# Altium project avr32da32_evalboard.PrjPcb
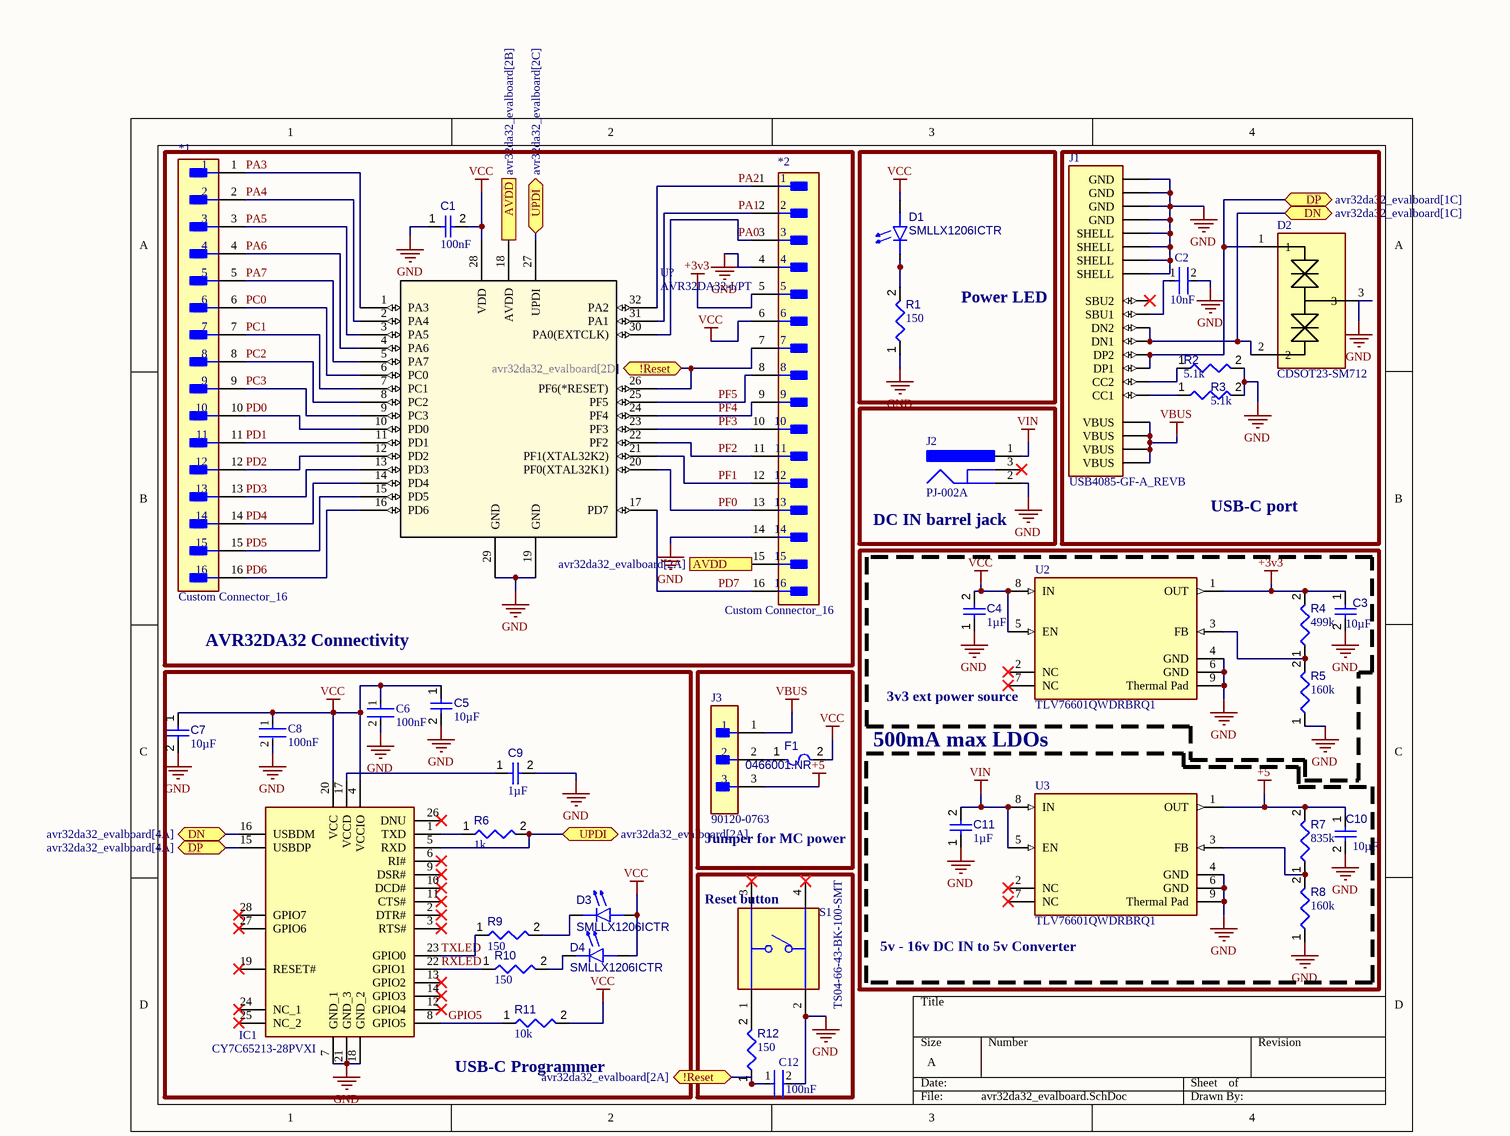
[diagram p0: avr32da32_evalboard.SchDoc]
1 sheet, 39 parts. Net scope: flat (ports and power ports of the same name join across sheets).
Board file: avr32da32_evalboard.PcbDoc

## Sheet avr32da32_evalboard.SchDoc
size A; SheetNumber: 1; SheetTotal: 1

### Parts
*1  Custom Connector_16  [Custom Connector_16]
*2  Custom Connector_16  [Custom Connector_16]
C1  value 100nF  [CAPC3216X180X50ML20T25]  (hidden comment: Capacitor 10 uF +/- 10% 16 V 1206)
C2  10nF  [FP-GR331B-0_2-IPC_C]
C3  value 10µF  [CAPC3216X180X50NL20T25]  (hidden comment: Capacitor 10 uF +/- 10% 16 V 1206)
C4  value 1µF  [CAPC3216X180X20ML20]  (hidden comment: Capacitor 1 uF +/- 10% 25 V 1206)
C5  value 10µF  [CAPC3216X180X50NL20T25]  (hidden comment: Capacitor 10 uF +/- 10% 16 V 1206)
C6  100nF  [FP-1206-L_3_2_0_2-W_1_6_0-MFG]
C7  value 10µF  [CAPC3216X180X50NL20T25]  (hidden comment: Capacitor 10 uF +/- 10% 16 V 1206)
C8  100nF  [FP-1206-L_3_2_0_2-W_1_6_0-MFG]
C9  value 1µF  [CAPC3216X180X20ML20]  (hidden comment: Capacitor 1 uF +/- 10% 25 V 1206)
C10  value 10µF  [CAPC3216X180X50NL20T25]  (hidden comment: Capacitor 10 uF +/- 10% 16 V 1206)
C11  value 1µF  [CAPC3216X180X20ML20]  (hidden comment: Capacitor 1 uF +/- 10% 25 V 1206)
C12  100nF  [FP-1206-L_3_2_0_2-W_1_6_0-MFG]
D1  SMLLX1206ICTR  [LUMX-SML-LX1206IC_V]
D2  CDSOT23-SM712  [SOT95P230X117-3N]
D3  SMLLX1206ICTR  [LUMX-SML-LX1206IC_V]
D4  SMLLX1206ICTR  [LUMX-SML-LX1206IC_V]
F1  0466001.NR  [FP-0466-MFG]
IC1  CY7C65213-28PVXI  [SOP65P780X200-28N]
J1  USB4085-GF-A_REVB  [GCT_USB4085-GF-A_REVB]
J2  PJ-002A  [CUI-PJ-002A_V]
J3  90120-0763  [FP-90120-0763-MFG]
R1  value 150  [FP-CR1206-IPC_C]  (hidden comment: CR1206-JW-151ELF)
R2  value 5.1k  [FP-CR1206-IPC_C]  (hidden comment: CR1206-JW-151ELF)
R3  value 5.1k  [FP-CR1206-IPC_C]  (hidden comment: CR1206-JW-151ELF)
R4  value 499k  [FP-RT1206-IPC_C]  (hidden comment: RT1206DRD07499KL)
R5  value 160k  [FP-RT1206-IPC_C]  (hidden comment: RT1206FRE07160KL)
R6  value 1k  [FP-MCA1206-IPC_B]  (hidden comment: MCA1206MD1001BP100)
R7  value 835k  [FP-RT1206-IPC_C]  (hidden comment: RT1206DRD07499KL)
R8  value 160k  [FP-RT1206-IPC_C]  (hidden comment: RT1206FRE07160KL)
R9  value 150  [FP-CR1206-IPC_C]  (hidden comment: CR1206-JW-151ELF)
R10  value 150  [FP-CR1206-IPC_C]  (hidden comment: CR1206-JW-151ELF)
R11  value 10k  [RESC3216X60X45ML15T20]  (hidden comment: Resistor 10k +/-1% 1206 250 mW)
R12  value 150  [FP-CR1206-IPC_C]  (hidden comment: CR1206-JW-151ELF)
S1  TS04-66-43-BK-100-SMT  [SW_TS04-66-43-BK-100-SMT]
U2  TLV76601QWDRBRQ1  [FP-DRB0008J-IPC_C]
U3  TLV76601QWDRBRQ1  [FP-DRB0008J-IPC_C]
U?  AVR32DA32-I/PT  [QFP80P900X900X120-32N]

### Blocks framed on the sheet
AVR32DA32 Connectivity: *1 *2 C1 U?
Power LED: D1 R1
USB-C port: C2 D2 J1 R2 R3
DC IN barrel jack: J2
3v3 ext power source: C3 C4 R4 R5 U2
USB-C Programmer: C5-C9 D3 D4 IC1 R6 R9-R11
Jumper for MC power: F1 J3
500mA max LDOs: C10 C11 R7 R8 U3
Reset button: C12 R12 S1

### Ports
!Reset (bidir, see avr32da32_evalboard[2A]), !Reset (bidir, see avr32da32_evalboard[2D]), AVDD (see avr32da32_evalboard[2A]), AVDD (see avr32da32_evalboard[2B]), DN (bidir, see avr32da32_evalboard[1C]), DN (bidir, see avr32da32_evalboard[4A]), DP (bidir, see avr32da32_evalboard[1C]), DP (bidir, see avr32da32_evalboard[4A]), UPDI (bidir, see avr32da32_evalboard[2A]), UPDI (bidir, see avr32da32_evalboard[2C])

### Nets
+3v3: *2.5 C3.1 R4.2 U2.1(OUT)
+5: C10.1 J3.3 R7.2 U3.1(OUT)
GND: *2.4 *2.14 C1.1 C2.2 C3.2 C4.1 C5.2 C6.2 C7.2 C8.2 C9.2 C10.2 C11.1 C12.2 D2.3 IC1.7(GND_1) IC1.18(GND_2) IC1.21(GND_3) J1.A1(GND) J1.A12(GND) J1.B1(GND) J1.B12(GND) J1.S1(SHELL) J1.S2(SHELL) J1.S3(SHELL) J1.S4(SHELL) J2.2 R1.1 R2.2 R3.2 R5.1 R8.1 S1.2 U2.4(GND) U2.6(GND) U2.9(Thermal_Pad) U3.4(GND) U3.6(GND) U3.9(Thermal_Pad) U?.19(GND) U?.29(GND)
VBUS: J1.A4(VBUS) J1.A9(VBUS) J1.B4(VBUS) J1.B9(VBUS) J3.1
VCC: *2.6 C1.2 C4.2 C5.1 C6.1 C7.1 C8.1 D1.2(A) D3.2(A) D4.2(A) F1.2 IC1.4(VCCIO) IC1.20(VCC) R11.2 U2.5(EN) U2.8(IN) U?.28(VDD)
VIN: C11.2 J2.1 U3.5(EN) U3.8(IN)
GPIO5: IC1.8(GPIO5) R11.1
PA0: *2.3 U?.30(PA0(EXTCLK))
PA1: *2.2 U?.31(PA1)
PA2: *2.1 U?.32(PA2)
PA3: *1.1 U?.1(PA3)
PA4: *1.2 U?.2(PA4)
PA5: *1.3 U?.3(PA5)
PA6: *1.4 U?.4(PA6)
PA7: *1.5 U?.5(PA7)
PC0: *1.6 U?.6(PC0)
PC1: *1.7 U?.7(PC1)
PC2: *1.8 U?.8(PC2)
PC3: *1.9 U?.9(PC3)
PD0: *1.10 U?.10(PD0)
PD1: *1.11 U?.11(PD1)
PD2: *1.12 U?.12(PD2)
PD3: *1.13 U?.13(PD3)
PD4: *1.14 U?.14(PD4)
PD5: *1.15 U?.15(PD5)
PD6: *1.16 U?.16(PD6)
PD7: *2.16 U?.17(PD7)
PF0: *2.13 U?.20(PF0(XTAL32K1))
PF1: *2.12 U?.21(PF1(XTAL32K2))
PF2: *2.11 U?.22(PF2)
PF3: *2.10 U?.23(PF3)
PF4: *2.9 U?.24(PF4)
PF5: *2.8 U?.25(PF5)
RXLED: IC1.22(GPIO1) R10.1
TXLED: IC1.23(GPIO0) R9.1
Net*2_7: *2.7 C12.1 R12.1 U?.26(PF6(*RESET)) ; port !Reset
Net*2_15: *2.15 U?.18(AVDD) ; port AVDD
NetC2_1: C2.1 J1.A8(SBU1)
NetC9_1: C9.1 IC1.17(VCCD)
NetD1_1: D1.1(K) R1.2
NetD2_1: D2.1 IC1.15(USBDP) J1.A6(DP1) J1.B6(DP2) ; port DP
NetD2_2: D2.2 IC1.16(USBDM) J1.A7(DN1) J1.B7(DN2) ; port DN
NetD3_1: D3.1(K) R9.2
NetD4_1: D4.1(K) R10.2
NetF1_1: F1.1 J3.2
NetIC1_1: IC1.1(TXD) R6.1
NetIC1_5: IC1.5(RXD) R6.2 U?.27(UPDI) ; port UPDI
NetJ1_A5: J1.A5(CC1) R3.1
NetJ1_B5: J1.B5(CC2) R2.1
NetR4_1: R4.1 R5.2 U2.3(FB)
NetR7_1: R7.1 R8.2 U3.3(FB)
NetR12_2: R12.2 S1.1

Not connected (* = marked no-connect by the designer): IC1 2(DTR#)* 3(RTS#)* 6(RI#)* 9(DSR#)* 10(DCD#)* 11(CTS#)* 12(GPIO4)* 13(GPIO2)* 14(GPIO3)* 19(RESET#)* 24(NC_1)* 25(NC_2)* 26(DNU)* 27(GPIO6)* 28(GPIO7)*; J1 B8(SBU2)*; J2 3*; S1 3* 4*; U2 2(NC)* 7(NC)*; U3 2(NC)* 7(NC)*

### Notes on the sheet
- (near U3) 5v - 16v DC IN to 5v Converter

### Library data of the parts
C1 C3 C5 C7 C10 = CMP-001-00016-6: Chip Capacitor, 10 uF, +/- 10%, 16 V, 1206 (3216 Metric); Capacitor Type: Ceramic; Voltage Rating: 16V; Tolerance: 10%; Min Operating Temperature: -55°C; Pins: 2; Mounting Technology: SM; Case/Package: 1206; Max Operating Temperature: 125°C; RoHS Compliant: True
C2 = CMP-06035-062347-1: CAP CER 10000PF 630V X7T 1206; Tolerance: 10%; Mount: Surface Mount; RoHS Compliant: Yes; Case/Package: 1206; Capacitance: 10nF; Construction: Flat; Series: GR3; REACH SVHC: No SVHC; Case Code (Imperial): 1206; Min Operating Temperature: -55°C; Depth: 1.6mm; Voltage Rating (DC): 630V; Height: 1.25mm; Max Operating Temperature: 125°C; Termination: SMD/SMT; Dielectric: X7T; Voltage Rating: 630V; Thickness: 0.049inch; Package Quantity: 1; Case Code (Metric): 3216; Radiation Hardening: No; Length: 3.2mm; Width: 0.063inch; Packaging: Tape and Reel
C4 C9 C11 = CMP-001-00006-6: Chip Capacitor, 1 uF, +/- 10%, 25 V, 1206 (3216 Metric); Capacitor Type: Ceramic; Voltage Rating: 25V; Tolerance: 10%; Min Operating Temperature: -55°C; Pins: 2; Case/Package: 1206; Max Operating Temperature: 125°C; Mounting Technology: SM; RoHS Compliant: True
C6 C8 C12 = CMP-2000-05018-2: General Purpose Ceramic Capacitor, 1206, 100nF, 10%, X7R, 15%, 50V; Dissipation Factor: 2.5%; Insulation Resistance: 100GR; Dielectric: X7R; Thickness: 0.037inch; Case Code (Imperial): 1206; Case Code (Metric): 3216; Dielectric Material: Ceramic; Width: 1.6mm; Voltage Rating (DC): 50V; Termination: SMD/SMT; Tolerance: 10%; REACH SVHC: No SVHC; Height: 0.94mm; Length: 3.2mm; Voltage: 50V; Capacitance: 100nF; Packaging: Tape and Reel; Depth: 1.6mm; Voltage Rating: 50V; Series: -; Contact Plating: Tin; Mount: Surface Mount; Package Quantity: 1; Construction: Flat; Max Operating Temperature: 125°C; Min Operating Temperature: -55°C; Case/Package: 1206; Lead Free: Lead Free; RoHS Compliant: Yes; Number of Pins: 2; Radiation Hardening: No
D1 D3 D4 = CMP-007-00044-1: LED Uni-Color Red 635nm 2-Pin T/R
D2 = CDSOT23-SM712: Diode; Manufacturer_Name: Bourns; Datasheet Link: http://uk.rs-online.com/web/p/products/7673728; Height: 1.17mm; Manufacturer_Part_Number: CDSOT23-SM712; Mouser Part Number: 652-CDSOT23-SM712; Mouser Price/Stock: https://www.mouser.co.uk/ProductDetail/Bourns/CDSOT23-SM712?qs=FuI%252BOVLl4%2FLTY%2FGQ265RLA%3D%3D; Arrow Part Number: CDSOT23-SM712; Arrow Price/Stock: https://www.arrow.com/en/products/cdsot23-sm712/bourns?utm_currency=USD&region=europe
F1 = CMP-005-00014-1: Electric Fuse, Very Fast Blow, 1A, 63VAC, 63VDC, 50A (IR), Surface Mount, 1206; Current Rating: 1A; RoHS Compliant: Yes; Min Operating Temperature: -55°C; Mounting Technology: Surface Mount; Max Operating Temperature: 90°C
IC1 = CY7C65213-28PVXI: Integrated Circuit; Manufacturer_Name: Infineon; Datasheet Link: http://www.mouser.com/datasheet/2/100/001-81011_CY7C65213_USB-UART_LP_Bridge_Controller_-348826.pdf; Height: 2mm; Manufacturer_Part_Number: CY7C65213-28PVXI; Mouser Part Number: 727-CY7C65213-28PVXI; Mouser Price/Stock: https://www.mouser.co.uk/ProductDetail/Infineon-Technologies/CY7C65213-28PVXI?qs=dOK1vf2izjvExqwVZ7qYig%3D%3D; Arrow Part Number: CY7C65213-28PVXI; Arrow Price/Stock: https://www.arrow.com/en/products/cy7c65213-28pvxi/cypress-semiconductor?region=nac
J1 = CMP-012-000000-1: USB-C (USB TYPE-C) USB 2.0 æ’åº§è¿žæŽ¥å™¨ 24 (16+8 Dummy) ä½é€šå­”ã€ç›´è§’ã€ä½Žæˆæœ¬ã€3.46mm å¤–å½¢ã€16 é’ˆã€æ°´å¹³ã€é¡¶éƒ¨å®‰è£…; MF: Global Connector Technology; Pin Count: 20; Package: None; Check_prices: https://www.snapeda.com/parts/USB4085-GF-A/Global+Connector+Technology/view-part/?ref=eda; Value: *; Design Item ID: USB4085-GF-A_REVB; MP: USB4085-GF-A; Component Type: Standard; SnapEDA_Link: https://www.snapeda.com/parts/USB4085-GF-A/Global+Connector+Technology/view-part/?ref=snap; Source: USB4085-GF-A_REVB.SchLib
J2 = CMP-002-00078-1: 12V, 1A, 2mm Dia; Connector Type: Circular,Power; Voltage Rating: 12V; Mounting Technology: Board; RoHS Compliant: Yes
J3 = CMP-002-00075-2: Board Connector, 3 Contact(s), 1 Row(s), Male, Straight, 0.1 inch Pitch, Solder Terminal, Black Insulator, Receptacle; Mounting Technology: Board; Max Operating Temperature: 125°C; Connector Type: BOARD CONNECTOR; Min Operating Temperature: -55°C; RoHS Compliant: Yes
R1-R3 R9 R10 R12 = CMP-009-00182-1: Fixed Resistor, Metal Glaze/thick Film, 0.25W, 150ohm, 200V, 5% +/-Tol, 200ppm/Cel, Surface Mount, 1206; Power: 250mW; Case/Package: 1206; RoHS Compliant: Yes; Max Operating Temperature: 155°C; Tolerance: 5%; Pins: 2; Mounting Technology: Surface Mount; Min Operating Temperature: -55°C
R4 R7 = CMP-009-00185-1: Fixed Resistor, Thin Film, 0.25W, 499000ohm, 200V, 0.5% +/-Tol, 25ppm/Cel, Surface Mount, 1206; Power: 250mW; RoHS Compliant: Yes; Min Operating Temperature: -55°C; Pins: 2; Mounting Technology: Surface Mount; Case/Package: 1206; Max Operating Temperature: 155°C; Tolerance: 0.5%
R5 R8 = CMP-009-00184-1: Fixed Resistor, Thin Film, 0.25W, 160000ohm, 200V, 1% +/-Tol, 50ppm/Cel, Surface Mount, 1206; Power: 250mW; RoHS Compliant: Yes; Tolerance: 1%; Case/Package: 1206; Max Operating Temperature: 155°C; Min Operating Temperature: -55°C; Mounting Technology: Surface Mount; Pins: 2
R6 = CMP-009-00186-1: Fixed Resistor, Thin Film, 0.25W, 1000ohm, 200V, 0.1% +/-Tol, 25ppm/Cel, Surface Mount, 1206; Power: 400mW; Pins: 2; Max Operating Temperature: 155°C; Case/Package: 1206; RoHS Compliant: Yes; Tolerance: 0.1%; Min Operating Temperature: -55°C
R11 = CMP-009-00016-5: Chip Resistor, 10 KOhm, +/- 1%, 0.25 W, -55 to 155 degC, 1206 (3216 Metric); Power: 250mW; Voltage Rating: 200V; Pins: 2; Max Operating Temperature: 155°C; Tolerance: 1%; RoHS Compliant: True; Case/Package: 1206; Min Operating Temperature: -55°C; Mounting Technology: SM
S1 = CMP-014-000000-2: Tactile Switches 6 x 6 mm, 4.3 mm Act Height, 100 gf, Black, Surface Mount, SPST,; Availability: Unavailable; Component Type: Standard; Source: TS04-66-43-BK-100-SMT.SchLib; Package: None; Pin Count: 4; Price: None; Value: *; Design Item ID: TS04-66-43-BK-100-SMT; MP: TS04-66-43-BK-100-SMT
U2 U3 = CMP-019-00049-1: Adjustable Positive LDO Regulator, 0.8V Min, 14.6V Max, 0.75V Dropout, PDSO8
U? = CMP-031-00006-3: RISC Microcontroller, 8-Bit, FLASH, AVR CPU, 24MHz, CMOS, PQFP32; Mfr_Name: Microchip; Max Supply Voltage: 5.5V; Min Supply Voltage: 1.8V; RoHS Compliant: Yes; Design Item ID: AVR32DA32-IPT; Case/Package: TQFP32; RefDes: RefDes; ComponentLink1Description: https://www.digikey.ro/ro/products/detail/microchip-technology/AVR32DA32-I-PT/12396890; Type: Type; Source: AVR32DA32-IPT.SchLib; Mounting Technology: SMD